# Altium schematic sheet 07_Display_LCD.SchDoc
size A3; SheetNumber: 7; SheetTotal: 12
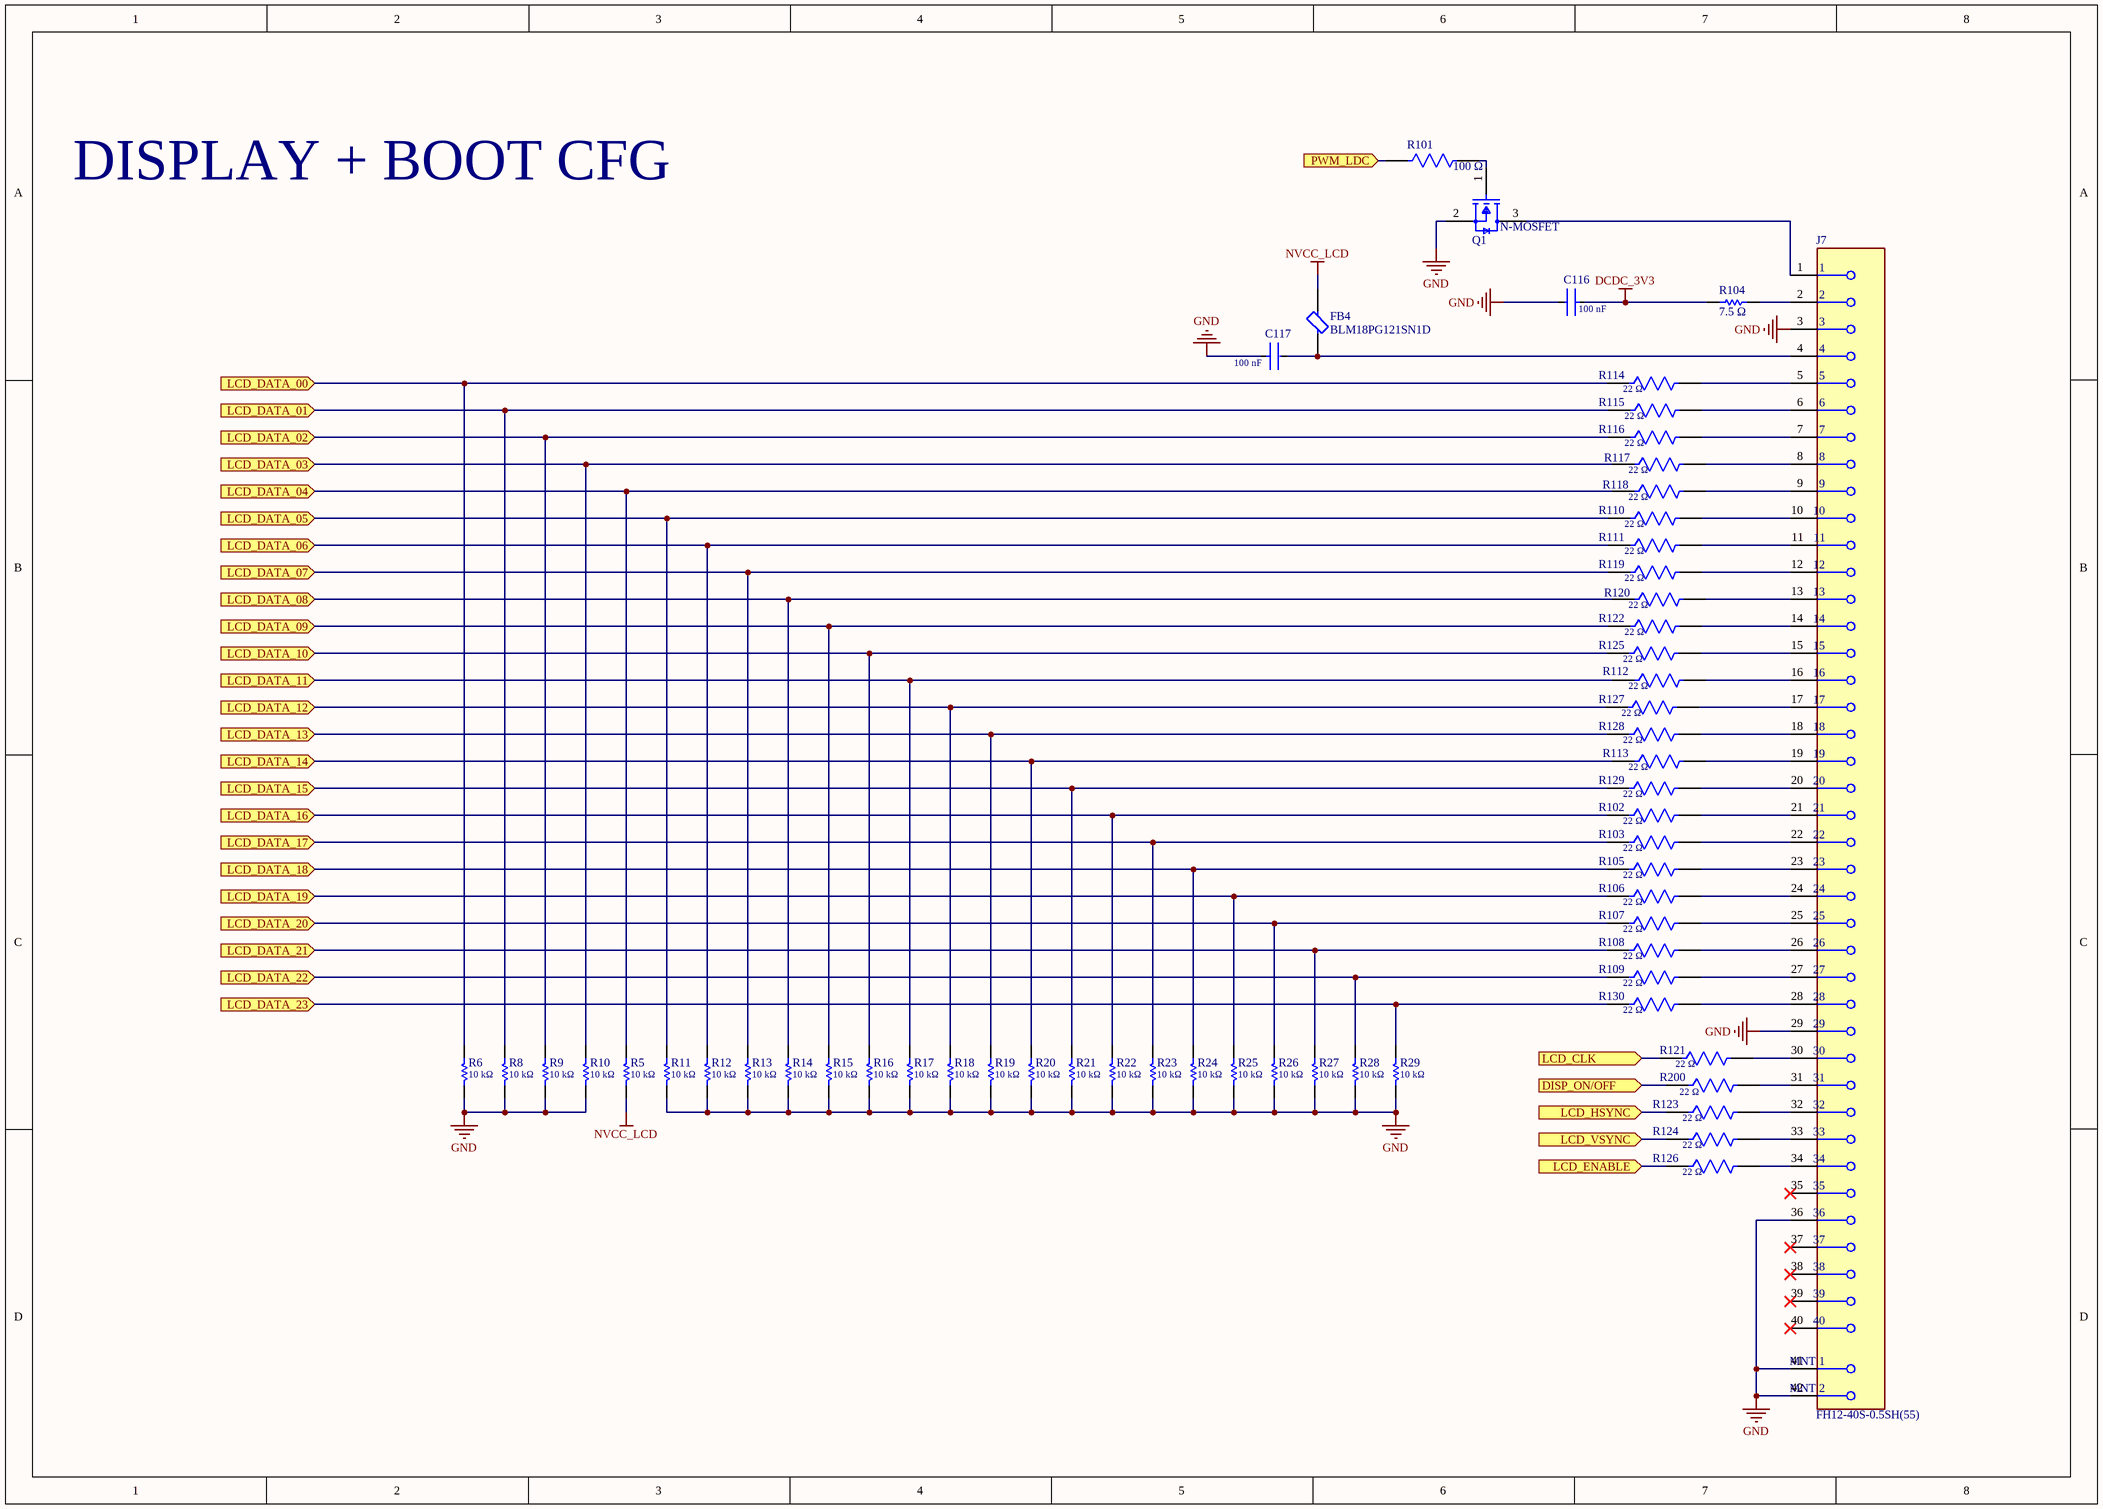
[diagram p0: 07_Display_LCD.SchDoc]

## Parts
C116  100 nF  [FP-CC0603-DA-MFG]
C117  100 nF  [FP-CC0603-DA-MFG]
FB4  BLM18PG121SN1D  [FP-BLM18-0_15-t0_8-IPC_A]
J7  FH12-40S-0.5SH(55)  [FP-FH12-40S-0_5SH_55-MFG]
Q1  N-MOSFET  [FP-PG-SOT23-3-MFG]
R5  10 kΩ  [RESC1608X55X25ML10T15]
R6  10 kΩ  [RESC1608X55X25ML10T15]
R8  10 kΩ  [RESC1608X55X25ML10T15]
R9  10 kΩ  [RESC1608X55X25ML10T15]
R10  10 kΩ  [RESC1608X55X25ML10T15]
R11  10 kΩ  [RESC1608X55X25ML10T15]
R12  10 kΩ  [RESC1608X55X25ML10T15]
R13  10 kΩ  [RESC1608X55X25ML10T15]
R14  10 kΩ  [RESC1608X55X25ML10T15]
R15  10 kΩ  [RESC1608X55X25ML10T15]
R16  10 kΩ  [RESC1608X55X25ML10T15]
R17  10 kΩ  [RESC1608X55X25ML10T15]
R18  10 kΩ  [RESC1608X55X25ML10T15]
R19  10 kΩ  [RESC1608X55X25ML10T15]
R20  10 kΩ  [RESC1608X55X25ML10T15]
R21  10 kΩ  [RESC1608X55X25ML10T15]
R22  10 kΩ  [RESC1608X55X25ML10T15]
R23  10 kΩ  [RESC1608X55X25ML10T15]
R24  10 kΩ  [RESC1608X55X25ML10T15]
R25  10 kΩ  [RESC1608X55X25ML10T15]
R26  10 kΩ  [RESC1608X55X25ML10T15]
R27  10 kΩ  [RESC1608X55X25ML10T15]
R28  10 kΩ  [RESC1608X55X25ML10T15]
R29  10 kΩ  [RESC1608X55X25ML10T15]
R101  100 Ω  [FP-RC0603-0_55-IPC_A]
R102  22 Ω  [FP-RC0603-0_55-IPC_C]
R103  22 Ω  [FP-RC0603-0_55-IPC_C]
R104  7.5 Ω  [RESC1608X55X25ML10T15]
R105  22 Ω  [FP-RC0603-0_55-IPC_C]
R106  22 Ω  [FP-RC0603-0_55-IPC_C]
R107  22 Ω  [FP-RC0603-0_55-IPC_C]
R108  22 Ω  [FP-RC0603-0_55-IPC_C]
R109  22 Ω  [FP-RC0603-0_55-IPC_C]
R110  22 Ω  [FP-RC0603-0_55-IPC_C]
R111  22 Ω  [FP-RC0603-0_55-IPC_C]
R112  22 Ω  [FP-RC0603-0_55-IPC_C]
R113  22 Ω  [FP-RC0603-0_55-IPC_C]
R114  22 Ω  [FP-RC0603-0_55-IPC_C]
R115  22 Ω  [FP-RC0603-0_55-IPC_C]
R116  22 Ω  [FP-RC0603-0_55-IPC_C]
R117  22 Ω  [FP-RC0603-0_55-IPC_C]
R118  22 Ω  [FP-RC0603-0_55-IPC_C]
R119  22 Ω  [FP-RC0603-0_55-IPC_C]
R120  22 Ω  [FP-RC0603-0_55-IPC_C]
R121  22 Ω  [FP-RC0603-0_55-IPC_C]
R122  22 Ω  [FP-RC0603-0_55-IPC_C]
R123  22 Ω  [FP-RC0603-0_55-IPC_C]
R124  22 Ω  [FP-RC0603-0_55-IPC_C]
R125  22 Ω  [FP-RC0603-0_55-IPC_C]
R126  22 Ω  [FP-RC0603-0_55-IPC_C]
R127  22 Ω  [FP-RC0603-0_55-IPC_C]
R128  22 Ω  [FP-RC0603-0_55-IPC_C]
R129  22 Ω  [FP-RC0603-0_55-IPC_C]
R130  22 Ω  [FP-RC0603-0_55-IPC_C]
R200  22 Ω  [FP-RC0603-0_55-IPC_C]

## Ports
DISP_ON/OFF (in), LCD_CLK (in), LCD_DATA_00 (in), LCD_DATA_01 (in), LCD_DATA_02 (in), LCD_DATA_03 (in), LCD_DATA_04 (in), LCD_DATA_05 (in), LCD_DATA_06 (in), LCD_DATA_07 (in), LCD_DATA_08 (in), LCD_DATA_09 (in), LCD_DATA_10 (in), LCD_DATA_11 (in), LCD_DATA_12 (in), LCD_DATA_13 (in), LCD_DATA_14 (in), LCD_DATA_15 (in), LCD_DATA_16 (in), LCD_DATA_17 (in), LCD_DATA_18 (in), LCD_DATA_19 (in), LCD_DATA_20 (in), LCD_DATA_21 (in), LCD_DATA_22 (in), LCD_DATA_23 (in), LCD_ENABLE (in), LCD_HSYNC (in), LCD_VSYNC (in), PWM_LDC (in)

## Nets
DCDC_3V3: C116.1 R104.1
GND: C116.2 C117.1 J7.3 J7.29 J7.36 J7.41(MNT_1) J7.42(MNT_2) Q1.2(source) R6.1 R8.1 R9.1 R10.1 R11.1 R12.1 R13.1 R14.1 R15.1 R16.1 R17.1 R18.1 R19.1 R20.1 R21.1 R22.1 R23.1 R24.1 R25.1 R26.1 R27.1 R28.1 R29.1
NVCC_LCD: FB4.2 R5.1
DISP_ON/OFF: R200.1 ; port DISP_ON/OFF
LCD_CLK: R121.1 ; port LCD_CLK
LCD_DATA_00: R6.2 R114.1 ; port LCD_DATA_00
LCD_DATA_01: R8.2 R115.1 ; port LCD_DATA_01
LCD_DATA_02: R9.2 R116.1 ; port LCD_DATA_02
LCD_DATA_03: R10.2 R117.1 ; port LCD_DATA_03
LCD_DATA_04: R5.2 R118.1 ; port LCD_DATA_04
LCD_DATA_05: R11.2 R110.1 ; port LCD_DATA_05
LCD_DATA_06: R12.2 R111.1 ; port LCD_DATA_06
LCD_DATA_07: R13.2 R119.1 ; port LCD_DATA_07
LCD_DATA_08: R14.2 R120.1 ; port LCD_DATA_08
LCD_DATA_09: R15.2 R122.1 ; port LCD_DATA_09
LCD_DATA_10: R16.2 R125.1 ; port LCD_DATA_10
LCD_DATA_11: R17.2 R112.1 ; port LCD_DATA_11
LCD_DATA_12: R18.2 R127.1 ; port LCD_DATA_12
LCD_DATA_13: R19.2 R128.1 ; port LCD_DATA_13
LCD_DATA_14: R20.2 R113.1 ; port LCD_DATA_14
LCD_DATA_15: R21.2 R129.1 ; port LCD_DATA_15
LCD_DATA_16: R22.2 R102.1 ; port LCD_DATA_16
LCD_DATA_17: R23.2 R103.1 ; port LCD_DATA_17
LCD_DATA_18: R24.2 R105.1 ; port LCD_DATA_18
LCD_DATA_19: R25.2 R106.1 ; port LCD_DATA_19
LCD_DATA_20: R26.2 R107.1 ; port LCD_DATA_20
LCD_DATA_21: R27.2 R108.1 ; port LCD_DATA_21
LCD_DATA_22: R28.2 R109.1 ; port LCD_DATA_22
LCD_DATA_23: R29.2 R130.1 ; port LCD_DATA_23
LCD_ENABLE: R126.1 ; port LCD_ENABLE
LCD_HSYNC: R123.1 ; port LCD_HSYNC
LCD_VSYNC: R124.1 ; port LCD_VSYNC
PWM_LDC: R101.1 ; port PWM_LDC
NetC117_2: C117.2 FB4.1 J7.4
NetJ7_1: J7.1 Q1.3(drain)
NetJ7_2: J7.2 R104.2
NetJ7_5: J7.5 R114.2
NetJ7_6: J7.6 R115.2
NetJ7_7: J7.7 R116.2
NetJ7_8: J7.8 R117.2
NetJ7_9: J7.9 R118.2
NetJ7_10: J7.10 R110.2
NetJ7_11: J7.11 R111.2
NetJ7_12: J7.12 R119.2
NetJ7_13: J7.13 R120.2
NetJ7_14: J7.14 R122.2
NetJ7_15: J7.15 R125.2
NetJ7_16: J7.16 R112.2
NetJ7_17: J7.17 R127.2
NetJ7_18: J7.18 R128.2
NetJ7_19: J7.19 R113.2
NetJ7_20: J7.20 R129.2
NetJ7_21: J7.21 R102.2
NetJ7_22: J7.22 R103.2
NetJ7_23: J7.23 R105.2
NetJ7_24: J7.24 R106.2
NetJ7_25: J7.25 R107.2
NetJ7_26: J7.26 R108.2
NetJ7_27: J7.27 R109.2
NetJ7_28: J7.28 R130.2
NetJ7_30: J7.30 R121.2
NetJ7_31: J7.31 R200.2
NetJ7_32: J7.32 R123.2
NetJ7_33: J7.33 R124.2
NetJ7_34: J7.34 R126.2
NetQ1_1: Q1.1(gate) R101.2

Not connected (* = marked no-connect by the designer): J7 35* 37* 38* 39* 40*

## Notes on the sheet
- DISPLAY + BOOT CFG

## Library data of the parts
C116 C117 = CMP-2100-03601-2: CAP CER 0.1UF 50V X7R 0603; Manufacturer: YAGEO; Manufacturer Part Number: CC0603KRX7R9BB104; Material: Ceramic; Temperature Coefficient: 15%; Tolerance: 0.1; Height: 0.9mm; Voltage: 50 V; ComponentLink2Description: Datasheet; Device Class L2: Capacitors; Temperature Range High: +125°C; Category: Cap; Capacitance: 100 nF; Footprint Url: http://www.yageo.com/exep/pages/download/literatures/UPY-C_GEN_24.pdf; ComponentLink2URL: http://www.yageo.com/documents/recent/UPY-GPHC_X7R_6.3V-to-50V_18.pdf; Package: CC0603-DA; Temperature: -55°C to +125°C; Voltage Rating: 50 V; Temperature Characteristic: X7R; Device Class L1: Passive Components; Temperature Range Low: -55°C; RoHS: TRUE; Automotive: No; Value: 100 nF; Device Class L3: Ceramic Capacitors; Octopart: https://octopart.com/cc0603krx7r9bb104-yageo-42244635; Mouser Description: Multilayer Ceramic Capacitor, CC Series, 0.1 - F, - 10%, X7R, 50 V, 0603 [1608 Metric]; Lead Free: Yes; Digikey Description: CAP CER 0.1UF 50V X7R 0603
FB4 = CMP-0686-00557-7: Chip Ferrite Bead, 0603, 120Ω @ 100MHz, 0.05Ω, 25%, 2A; Impedance: 120R; Number of Circuits: 1; Shielding: Unshielded; Material: Steel; DC Resistance (DCR): 50mR; Case Code (Imperial): 0603; RoHS Compliant: Yes; Number of Pins: 2; Min Operating Temperature: -55°C; Case Code (Metric): 1608; Frequency: 100MHz; Length: 1.6mm; Test Frequency: 100MHz; Max Operating Temperature: 125°C; Packaging: Tape and Reel; Max Current Rating: 2A; Termination: SMD/SMT; Lead Free: Lead Free; Max DC Current: 2A; Case/Package: 0603; Height: 0.8mm; Current Rating: 2A; Radiation Hardening: No; Core Material: Ferrite; DC Current: 2A; REACH SVHC: No SVHC; Package Quantity: 1; Depth: 0.8mm; Number of Lines: 1; Tolerance: 25%; Width: 0.8mm
J7 = CMP-2000-06267-2: CONN FFC BOTTOM 40POS 0.50MM R/A; Current Rating: 500mA; Voltage Rating: 50V; Contact Resistance: 50mR; Gender: Female; Pitch: 0.5mm; Max Current Rating: 400mA; Actuator Material: Polyphenylene; Wire/Cable Type: Straight; Mating Cycles: 20; Insulation Resistance: 500MR; Number of Contacts: 40; Contact Material: Bronze; RoHS Compliant: Yes; Housing Color: Beige; Mount: Surface Mount; Number of Rows: 1; Contact Location: Bottom; Lead Free: Lead Free; Package Quantity: 2000; Orientation: Right Angle; Insulation Material: Nylon; Flammability Rating: UL94 V-0; Max Operating Temperature: 70°C; Color: Beige; Length: 24.1mm; Lead Pitch: 0.5mm; Width: 24.1mm; Packaging: Tape and Reel; Depth: 5.6mm; Voltage Rating (AC): 50V; REACH SVHC: No SVHC; Contact Plating: Gold; Series: FH12; Min Operating Temperature: -40°C; Housing Material: Polyamide; Termination: Solder; Number of Positions: 40; Max Voltage Rating (AC): 50V
Q1 = CMP-32901-000180-1: MOSFET N-CH 60V 0.3A SOT23; Rise Time: 3.3ns; Input Capacitance: 20pF; Rds On Max: 3R; Gate to Source Voltage (Vgs): 20V; Continuous Drain Current (ID): 300mA; Max Power Dissipation: 500mW; Packaging: Tape and Reel; Mount: Surface Mount; Case/Package: SOT-23; Drain to Source Voltage (Vdss): 60V; Min Operating Temperature: -55°C; Halogen Free: Halogen Free; Max Dual Supply Voltage: 60V; Number of Pins: 3; Lead Free: Lead Free; Max Operating Temperature: 150°C
R5 R6 R8-R29 = CMP-2000-05022-1: Resistor, 10 KOhm, +/- 5%, 100 mW, -55 to 155 degC, 0603 (1608 Metric), RoHS, Tape and Reel; Manufacturer: Yageo; Resistance: 10kOhms; Voltage Rating: 50V; Temperature Coefficient: 100PPM/C; Power Rating: 100mW; Package Reference: 603; Series: RC; Case Code - mm: 1608; Packaging: Reel; Datasheet URL: http://www.farnell.com/datasheets/443971.pdf; Datasheet Version: Rev. 4, 04/2009; Operating Temperature Range: -55Cto+155C; Product: ThickFilmResistorsGeneralPurpose; Package Description: 2-Pin Surface Mount Device, Body 1.6 x 0.8 mm; Manufacturer URL: http://www.yageo.com/; Case Code - in: 0603; Tolerance: 5%; Termination Style: SMD/SMT
R101 = CMP-2100-03663-2: NexarPartId: 55402879; Voltage Rating: 50V; Power Rating: 100mW; Tolerance: 1%; Temperature Coefficient: 100ppm/°C; Resistance: 100Ω; Case/Package: 0603; Military Standard: Not; REACH SVHC: Unknown; Case Code (Metric): 0603; Max Operating Temperature: 155°C; Schedule B: 8533210045, 8533210045; Height: 450µm; Length: 1.6mm; Lead Free: Lead Free; Packaging: Tape & Reel; Case Code (Imperial): 0603; Composition: Thick Film; Min Operating Temperature: -55°C; Voltage Rating (DC): 50V; RoHS: Compliant; Depth: 800µm; Number of Pins: 2; Termination: SMD/SMT; Width: 800µm
R102 R103 R105-R130 R200 = CMP-03412-037819-1: RES SMD 22 OHM 5% 1/10W 0603; Temperature Coefficient: 100ppm/°C; Max Power Dissipation: 100mW; Voltage Rating: 50V; Resistance: 22R; Length: 1.6mm; Tolerance: 5%; Resistance Tolerance: 5%; Number of Terminations: 2; Construction: Rectangular; Min Operating Temperature: -55°C; Lead Free: Lead Free; Width: 0.8mm; Case Code (Imperial): 0603; Voltage Rating (DC): 50V; Case/Package: 0603; Features: Moisture Resistant; REACH SVHC: No SVHC; Military Standard: Not; RoHS Compliant: Yes; Max Operating Temperature: 155°C; Number of Pins: 2; Termination: SMD/SMT; Case Code (Metric): 1608; Packaging: Tape and Reel; Resistor Type: Thick Film; Depth: 0.8mm; Size Code: 0603; Power Rating: 100mW; Series: RC
R104 = CMP-2000-04140-1: Manufacturer: Yageo; Part Number: RC0603FR-077R5L